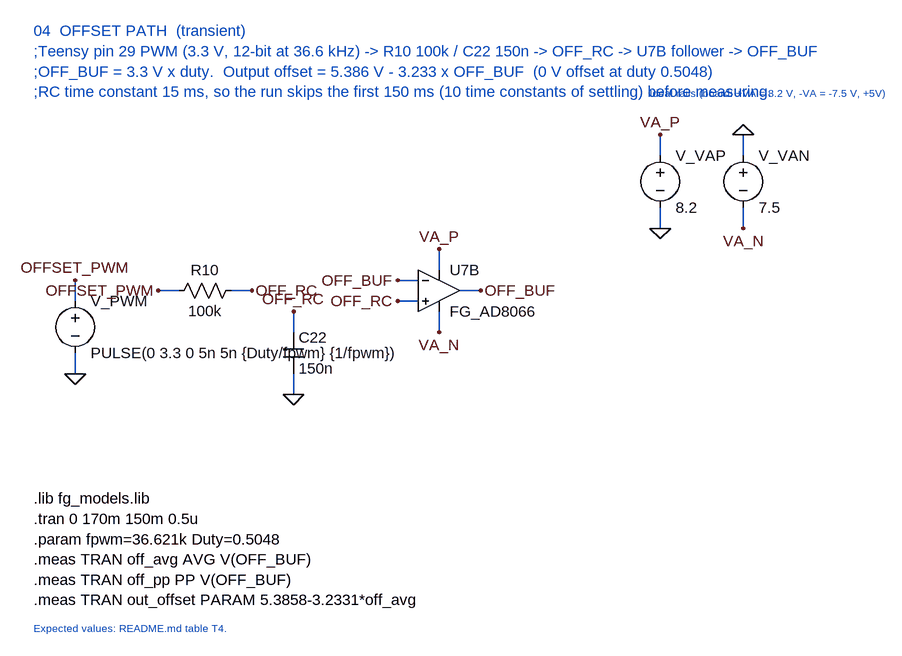
[diagram p0: schematic 04_offset_pwm.asc]
04_offset_pwm.asc, the LTspice schematic file:
Version 4
SHEET 1 2400 1600
WIRE 900 -240 900 -208
WIRE 900 -96 900 -128
WIRE 1028 -240 1028 -208
WIRE 1028 -96 1028 -128
WIRE 0 -16 0 16
WIRE 0 128 0 96
WIRE 272 0 240 0
WIRE 128 0 160 0
WIRE 336 32 336 64
WIRE 336 160 336 128
WIRE 496 16 528 16
WIRE 496 -16 528 -16
WIRE 560 -64 560 -32
WIRE 560 64 560 32
WIRE 624 0 592 0
FLAG 900 -240 VA_P
FLAG 900 -96 0
FLAG 1028 -240 0
FLAG 1028 -96 VA_N
FLAG 0 -16 OFFSET_PWM
FLAG 0 128 0
FLAG 272 0 OFF_RC
FLAG 128 0 OFFSET_PWM
FLAG 336 32 OFF_RC
FLAG 336 160 0
FLAG 496 16 OFF_RC
FLAG 496 -16 OFF_BUF
FLAG 560 -64 VA_P
FLAG 560 64 VA_N
FLAG 624 0 OFF_BUF
TEXT -64 -400 Left 2 ;04  OFFSET PATH  (transient)\n;Teensy pin 29 PWM (3.3 V, 12-bit at 36.6 kHz) -> R10 100k / C22 150n -> OFF_RC -> U7B follower -> OFF_BUF\n;OFF_BUF = 3.3 V x duty.  Output offset = 5.386 V - 3.233 x OFF_BUF  (0 V offset at duty 0.5048)\n;RC time constant 15 ms, so the run skips the first 150 ms (10 time constants of settling) before measuring.
SYMBOL voltage 900 -224 R0
SYMATTR InstName V_VAP
SYMATTR Value 8.2
SYMBOL voltage 1028 -224 R0
SYMATTR InstName V_VAN
SYMATTR Value 7.5
TEXT 884 -304 Left 1 ;Ideal rails (board: +VA = 8.2 V, -VA = -7.5 V, +5V)
SYMBOL voltage 0 0 R0
SYMATTR InstName V_PWM
SYMATTR Value PULSE(0 3.3 0 5n 5n {Duty/fpwm} {1/fpwm})
SYMBOL res 256 -16 R90
WINDOW 0 0 56 VBottom 2
WINDOW 3 32 56 VTop 2
SYMATTR InstName R10
SYMATTR Value 100k
SYMBOL cap 320 64 R0
SYMATTR InstName C22
SYMATTR Value 150n
SYMBOL OpAmps\\opamp2 560 -64 R0
SYMATTR InstName U7B
SYMATTR Value FG_AD8066
TEXT -64 320 Left 2 !.lib fg_models.lib\n.tran 0 170m 150m 0.5u\n.param fpwm=36.621k Duty=0.5048\n.meas TRAN off_avg AVG V(OFF_BUF)\n.meas TRAN off_pp PP V(OFF_BUF)\n.meas TRAN out_offset PARAM 5.3858-3.2331*off_avg
TEXT -64 520 Left 1 ;Expected values: README.md table T4.

The netlist it stands for:
* 04_offset_pwm.asc
V_VAP VA_P 0 8.2
V_VAN 0 VA_N 7.5
V_PWM OFFSET_PWM 0 PULSE(0 3.3 0 5n 5n {Duty/fpwm} {1/fpwm})
R10 OFF_RC OFFSET_PWM 100k
C22 OFF_RC 0 150n
XU7B OFF_RC OFF_BUF VA_P VA_N OFF_BUF FG_AD8066  ; pins In+ In- V+ V- OUT
* 04  OFFSET PATH  (transient)
* ;Teensy pin 29 PWM (3.3 V, 12-bit at 36.6 kHz) -> R10 100k / C22 150n -> OFF_RC -> U7B follower -> OFF_BUF
* ;OFF_BUF = 3.3 V x duty.  Output offset = 5.386 V - 3.233 x OFF_BUF  (0 V offset at duty 0.5048)
* ;RC time constant 15 ms, so the run skips the first 150 ms (10 time constants of settling) before measuring.
* Ideal rails (board: +VA = 8.2 V, -VA = -7.5 V, +5V)
.lib fg_models.lib
.tran 0 170m 150m 0.5u
.param fpwm=36.621k Duty=0.5048
.meas TRAN off_avg AVG V(OFF_BUF)
.meas TRAN off_pp PP V(OFF_BUF)
.meas TRAN out_offset PARAM 5.3858-3.2331*off_avg
* Expected values: README.md table T4.
.backanno
.end